# Altium schematic sheet POWER.SchDoc
size A4; SheetNumber: 8; SheetTotal: 11
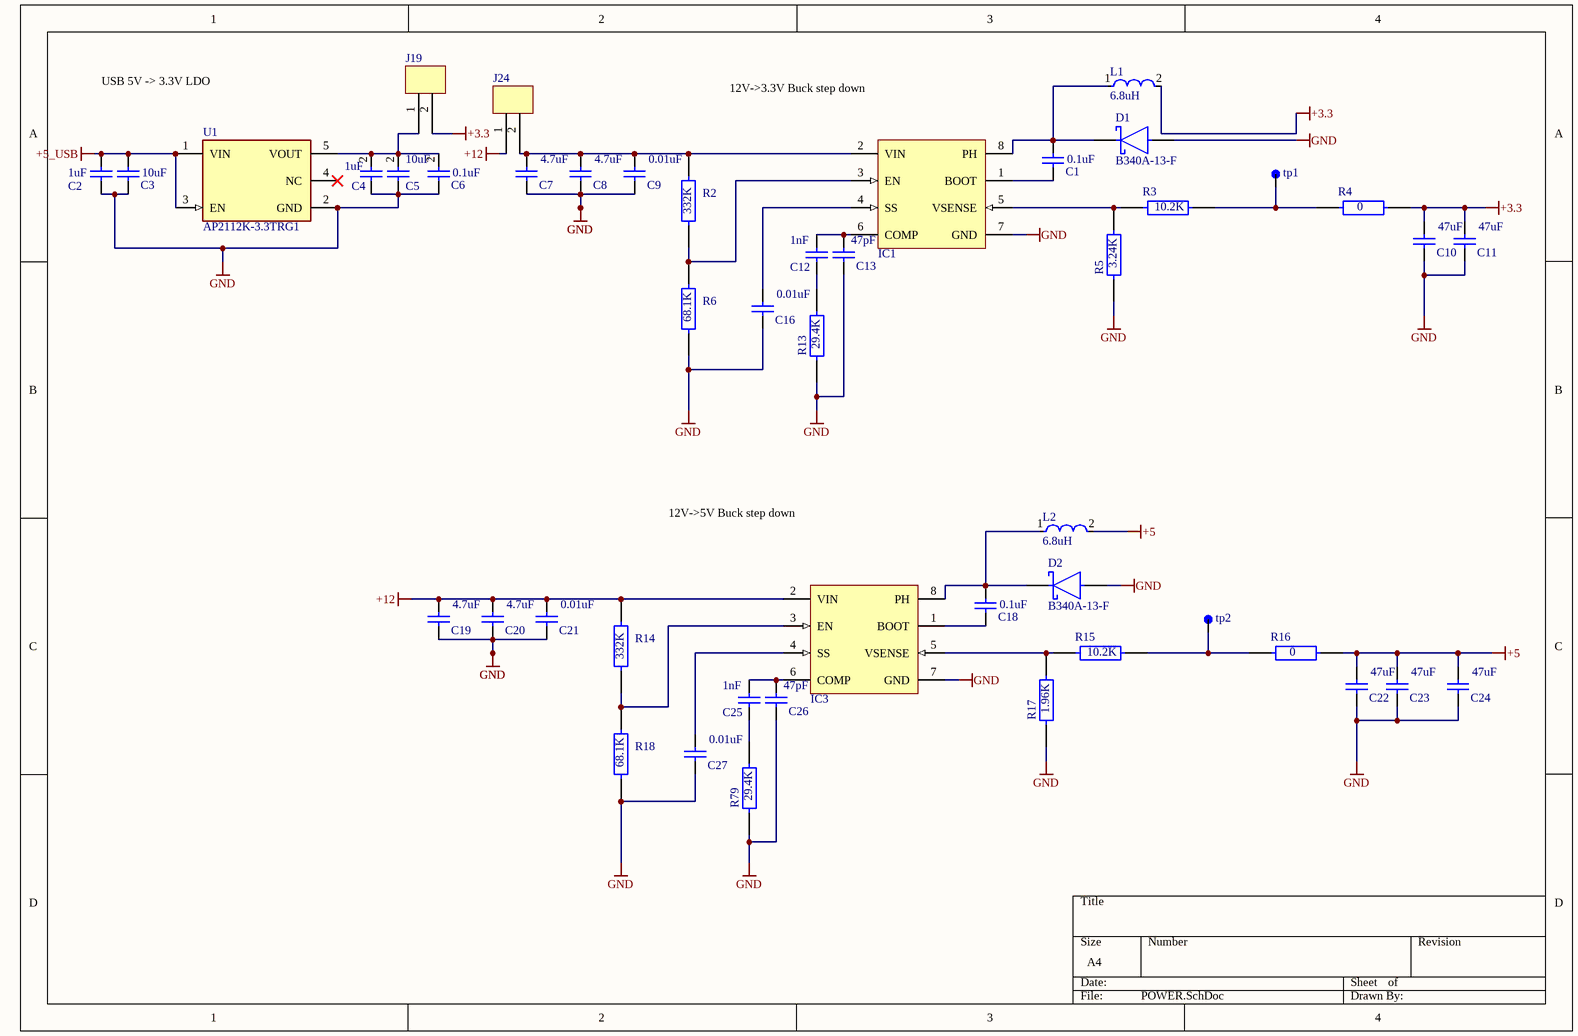
[diagram p0: POWER.SchDoc]

## Parts
C1  0.1uF  [CAPC2013X145X48NL20T23]
C2  1uF  [CAPC2013X145X48NL20T23]
C3  10uF  [CAPC2013X145X48NL20T23]
C4  1uF  [CAPC2013X145X48NL20T23]
C5  10uF  [CAPC2013X145X48NL20T23]
C6  0.1uF  [CAPC2013X145X48NL20T23]
C7  4.7uF  [CAPC2013X145X48NL20T23]
C8  4.7uF  [CAPC2013X145X48NL20T23]
C9  0.01uF  [CAPC2013X145X48NL20T23]
C10  47uF  [CAP_1210]
C11  47uF  [CAP_1210]
C12  1nF  [CAPC2013X145X48NL20T23]
C13  47pF  [CAPC2013X145X48NL20T23]
C16  0.01uF  [CAPC2013X145X48NL20T23]
C18  0.1uF  [CAPC2013X145X48NL20T23]
C19  4.7uF  [CAPC2013X145X48NL20T23]
C20  4.7uF  [CAPC2013X145X48NL20T23]
C21  0.01uF  [CAPC2013X145X48NL20T23]
C22  47uF  [CAP_1210]
C23  47uF  [CAP_1210]
C24  47uF  [CAP_1210]
C25  1nF  [CAPC2013X145X48NL20T23]
C26  47pF  [CAPC2013X145X48NL20T23]
C27  0.01uF  [CAPC2013X145X48NL20T23]
D1  B340A-13-F  [FP-SMA-MFG]
D2  B340A-13-F  [FP-SMA-MFG]
IC1  TPS54331DG4  [D8_N]  (value not drawn)
IC3  TPS54331DG4  [D8_N]  (value not drawn)
J19  Pinheader_1x2  [HDR_1x2_P2.54]  (value not drawn)
J24  Pinheader_1x2  [HDR_1x2_P2.54]  (value not drawn)
L1  6.8uH  [IND_SRN6045]
L2  6.8uH  [IND_SRN6045]
R2  332K  [FP-RN73R2A-IPC_A]
R3  10.2K  [FP-RN73R2A-IPC_A]
R4  0  [FP-RN73R2A-IPC_A]
R5  3.24K  [FP-RN73R2A-IPC_A]
R6  68.1K  [FP-RN73R2A-IPC_A]
R13  29.4K  [FP-RN73R2A-IPC_A]
R14  332K  [FP-RN73R2A-IPC_A]
R15  10.2K  [FP-RN73R2A-IPC_A]
R16  0  [FP-RN73R2A-IPC_A]
R17  1.96K  [FP-RN73R2A-IPC_A]
R18  68.1K  [FP-RN73R2A-IPC_A]
R79  29.4K  [FP-RN73R2A-IPC_A]
tp1  3.3V  [TP]  (value not drawn)
tp2  3.3V  [TP]  (value not drawn)
U1  AP2112K-3.3TRG1  [FP-SOT25-IPC_A]

## Nets
+3.3: C10.2 C11.2 J19.2 L1.2 R4.1
+5: C22.2 C23.2 C24.2 L2.2 R16.1
+5_USB: C2.2 C3.2 U1.1(VIN) U1.3(EN)
+12: C19.2 C20.2 C21.2 IC3.2(VIN) J24.1 R14.2
GND: C2.1 C3.1 C4.1 C5.1 C6.1 C7.1 C8.1 C9.1 C10.1 C11.1 C13.1 C16.1 C19.1 C20.1 C21.1 C22.1 C23.1 C24.1 C26.1 C27.1 D1.2(A) D2.2(A) IC1.7(GND) IC3.7(GND) R5.1 R6.1 R13.1 R17.1 R18.1 R79.1 U1.2(GND)
NetC1_1: C1.1 IC1.1(BOOT)
NetC1_2: C1.2 D1.1(C) IC1.8(PH) L1.1
NetC4_2: C4.2 C5.2 C6.2 J19.1 U1.5(VOUT)
NetC7_2: C7.2 C8.2 C9.2 IC1.2(VIN) J24.2 R2.2
NetC12_1: C12.1 R13.2
NetC12_2: C12.2 C13.2 IC1.6(COMP)
NetC16_2: C16.2 IC1.4(SS)
NetC18_1: C18.1 IC3.1(BOOT)
NetC18_2: C18.2 D2.1(C) IC3.8(PH) L2.1
NetC25_1: C25.1 R79.2
NetC25_2: C25.2 C26.2 IC3.6(COMP)
NetC27_2: C27.2 IC3.4(SS)
NetIC1_3: IC1.3(EN) R2.1 R6.2
NetIC1_5: IC1.5(VSENSE) R3.2 R5.2
NetIC3_3: IC3.3(EN) R14.1 R18.2
NetIC3_5: IC3.5(VSENSE) R15.2 R17.2
NetR3_1: R3.1 R4.2 tp1.1
NetR15_1: R15.1 R16.2 tp2.1

Not connected (* = marked no-connect by the designer): U1 4(NC)*

## Notes on the sheet
- USB 5V -> 3.3V LDO
- (near IC1) 12V->3.3V Buck step down
- 12V->5V Buck step down

## Library data of the parts
C1-C13 C16 C18-C27 = CAP: Manufacturer: Vitramon; Part Number: VJ0805Y682KXAMT
D1 D2 = SCHOTTKY: DIODE SCHOTTKY 40V 3A SMA; Max Forward Surge Current (Ifsm): 80A; Forward Voltage: 500mV; Polarity: Standard; Max Reverse Current: 500uA; Capacitance: 250pF; Element Configuration: Single; Mount: Surface Mount; Output Current: 3A; Radiation Hardening: No; Width: 2.92mm; Current Rating: 3A; Termination: SMD/SMT; Voltage: 40V; Series: -; Max Operating Temperature: 125°C; Current: 3A; Max Repetitive Reverse Voltage (Vrrm): 40V; Min Operating Temperature: -55°C; REACH SVHC: No SVHC; Number of Pins: 2; Average Rectified Current: 3A; Contact Plating: Tin; RoHS Compliant: Yes; Max Reverse Voltage (DC): 40V; Packaging: Tape and Reel; Height: 2.3mm; Length: 4.6mm; Case/Package: SMA; Weight: 0.002258oz; Peak Non-Repetitive Surge Current: 80A; Package Quantity: 5000; Lead Free: Lead Free; Forward Current: 3A; Voltage Rating (DC): 40V
IC1 IC3 = TPSS54331: Buck Step Down Regulator with 3.5 to 28 V Input and 0.8 to 25 V Output, -40 to 150 degC, 8-Pin SOIC (D), Green (RoHS & no Sb/Br); Manufacturer: Texas Instruments; Vin(Max)(V): 28; Vout(Min)(V): 0.8; Vin(Min)(V): 3.5; Duty Cycle(Max)(%): 90; Regulated Outputs(#): 1; SubFamily: Step-Down Regulator; Iq(Typ)(mA): 0.11; Iout(Max)(A): 3; Rating: Catalog; Vout(Max)(V): 25; PackageDescription: 8-Pin Plastic Small Outline Integrated Circuit, 4.9 x 3.9 mm, Pitch 1.27 mm Pitch; ComponentLink1Description: Datasheet; DatasheetVersion: SLVS839D; PackageReference: D8; ComponentLink1URL: http://www.ti.com/general/docs/lit/getliterature.tsp?genericPartNumber=TPS54331&fileType=pdf; Code_JEDEC: MS-012AA; ComponentLink2URL: http://www.ti.com/litv/pdf/msoi002j; PartNumber: TPS54331DG4; Switch Current Limit(Typ)(A): 3.5; Mounting Technology: Surface Mount; Eco-Plan: Green (RoHS & no Sb/Br); ComponentLink3URL: Samples URL:http://www.ti.com/product/tps54331#samples; ComponentLink3Description: URL Link1; Topology: Buck; PackageVersion: revM, Jun-2011; ComponentLink2Description: Package Specification
L1 L2 = Inductor: 6.8uH shielded power inductor 6x6 mm, Isat >= 2 A (e.g. Bourns SRN6045TA-6R8M); NexarPartId: 6751235; DC Resistance (DCR): 50mΩ; Max DC Current: 2A; Self Resonant Frequency: 1.2GHz; Tolerance: 2%; Inductance: 110nH; Test Frequency: 7.9MHz; Q Factor: 19; Core Material: Ceramic, Ferrite; Length: 2.29mm; Termination: SMD/SMT; Weight: 5.499807mg; RoHS: Compliant; Ambient Temperature Range High: 85°C; RMS Current (Irms): 2A; Height: 1.6mm; Lifecycle Status: Production; Case/Package: 0805; Series Resistance: 50mΩ; Min Operating Temperature: -40°C; Composition: Wirewound; Max Operating Temperature: 85°C; Lead Free: Contains Lead; Width: 1.91mm
R2-R6 R13-R18 R79 = Resistor: RES 10K OHM 0.1% 1/8W 0805
tp1 tp2 = Testpoint: Value: Test point
U1 = CMP-12756-000035-1: IC REG LINEAR 3.3V 600MA SOT25; Number of Regulators: 1; Output Type: Fixed; Polarity: Positive; Min Input Voltage: 2.5V; Max Input Voltage: 6V; Accuracy: 1.5%; Quiescent Current: 55uA; Dropout Voltage: 250mV; Min Operating Temperature: -40°C; Length: 3.1mm; Output Current: 600mA; Max Operating Temperature: 85°C; Package Quantity: 1; Output Voltage: 3.3V; Width: 1.7mm; Number of Outputs: 1; Packaging: Tape and Reel; Height: 1.3mm; Lead Free: Lead Free; Max Output Current: 600mA; Case/Package: SOT-23-5; Mount: Surface Mount; Number of Pins: 5